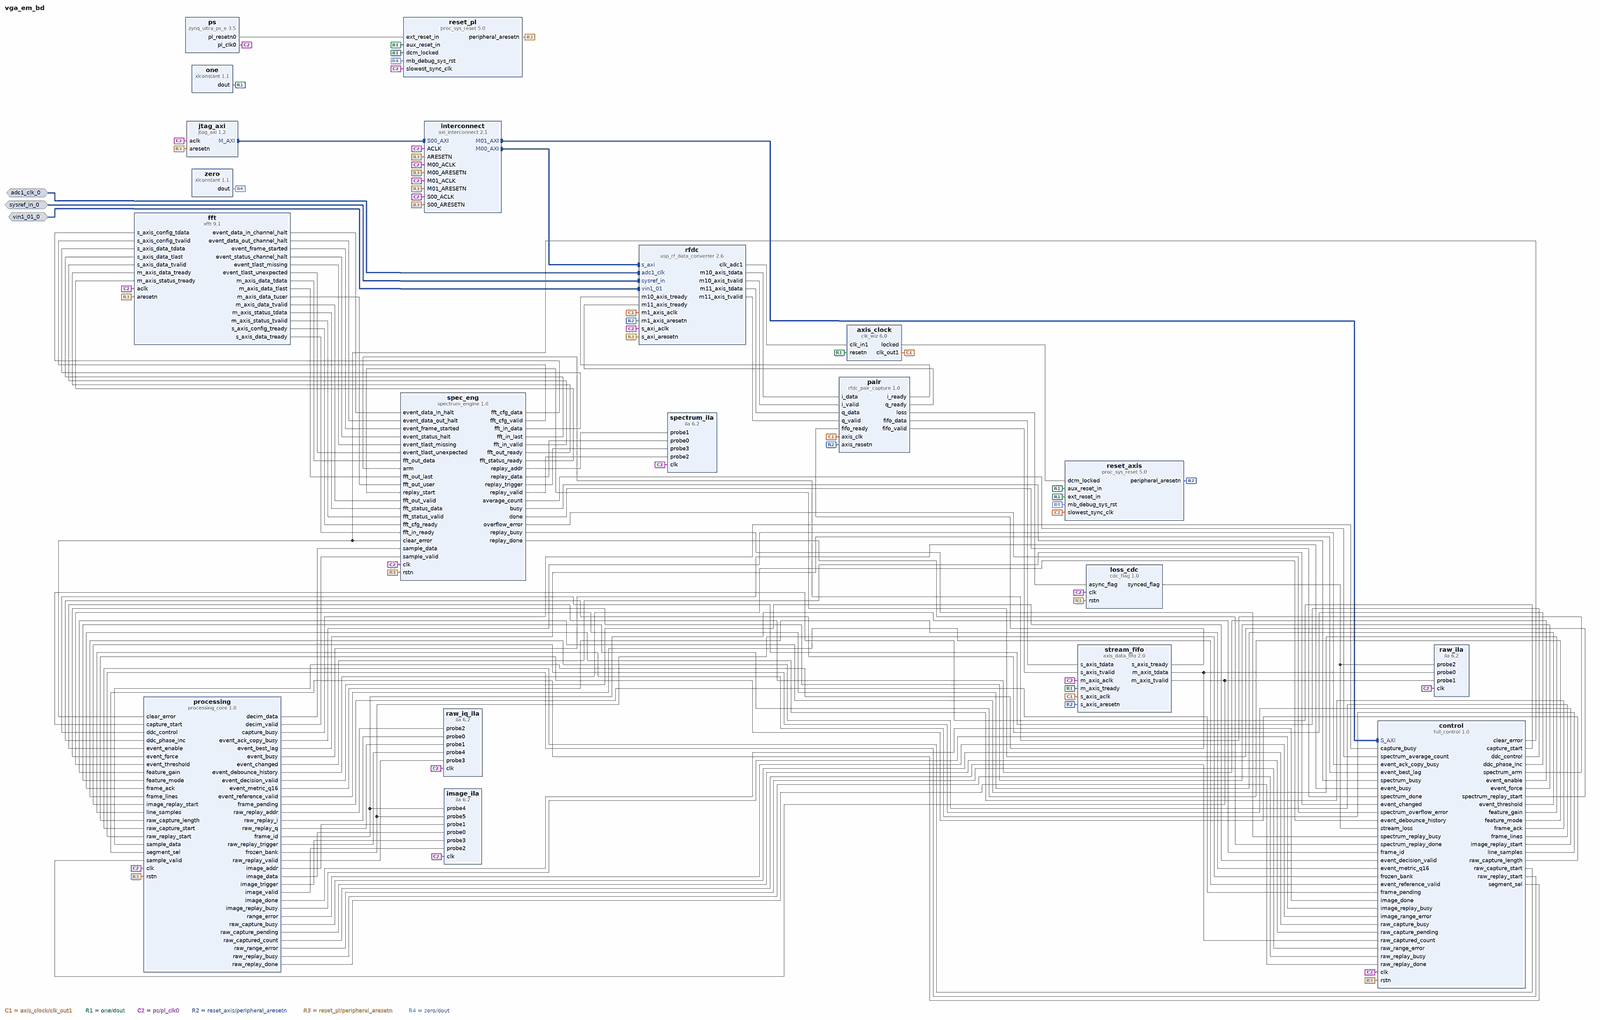
[diagram p0: block diagram of the top level, whole]
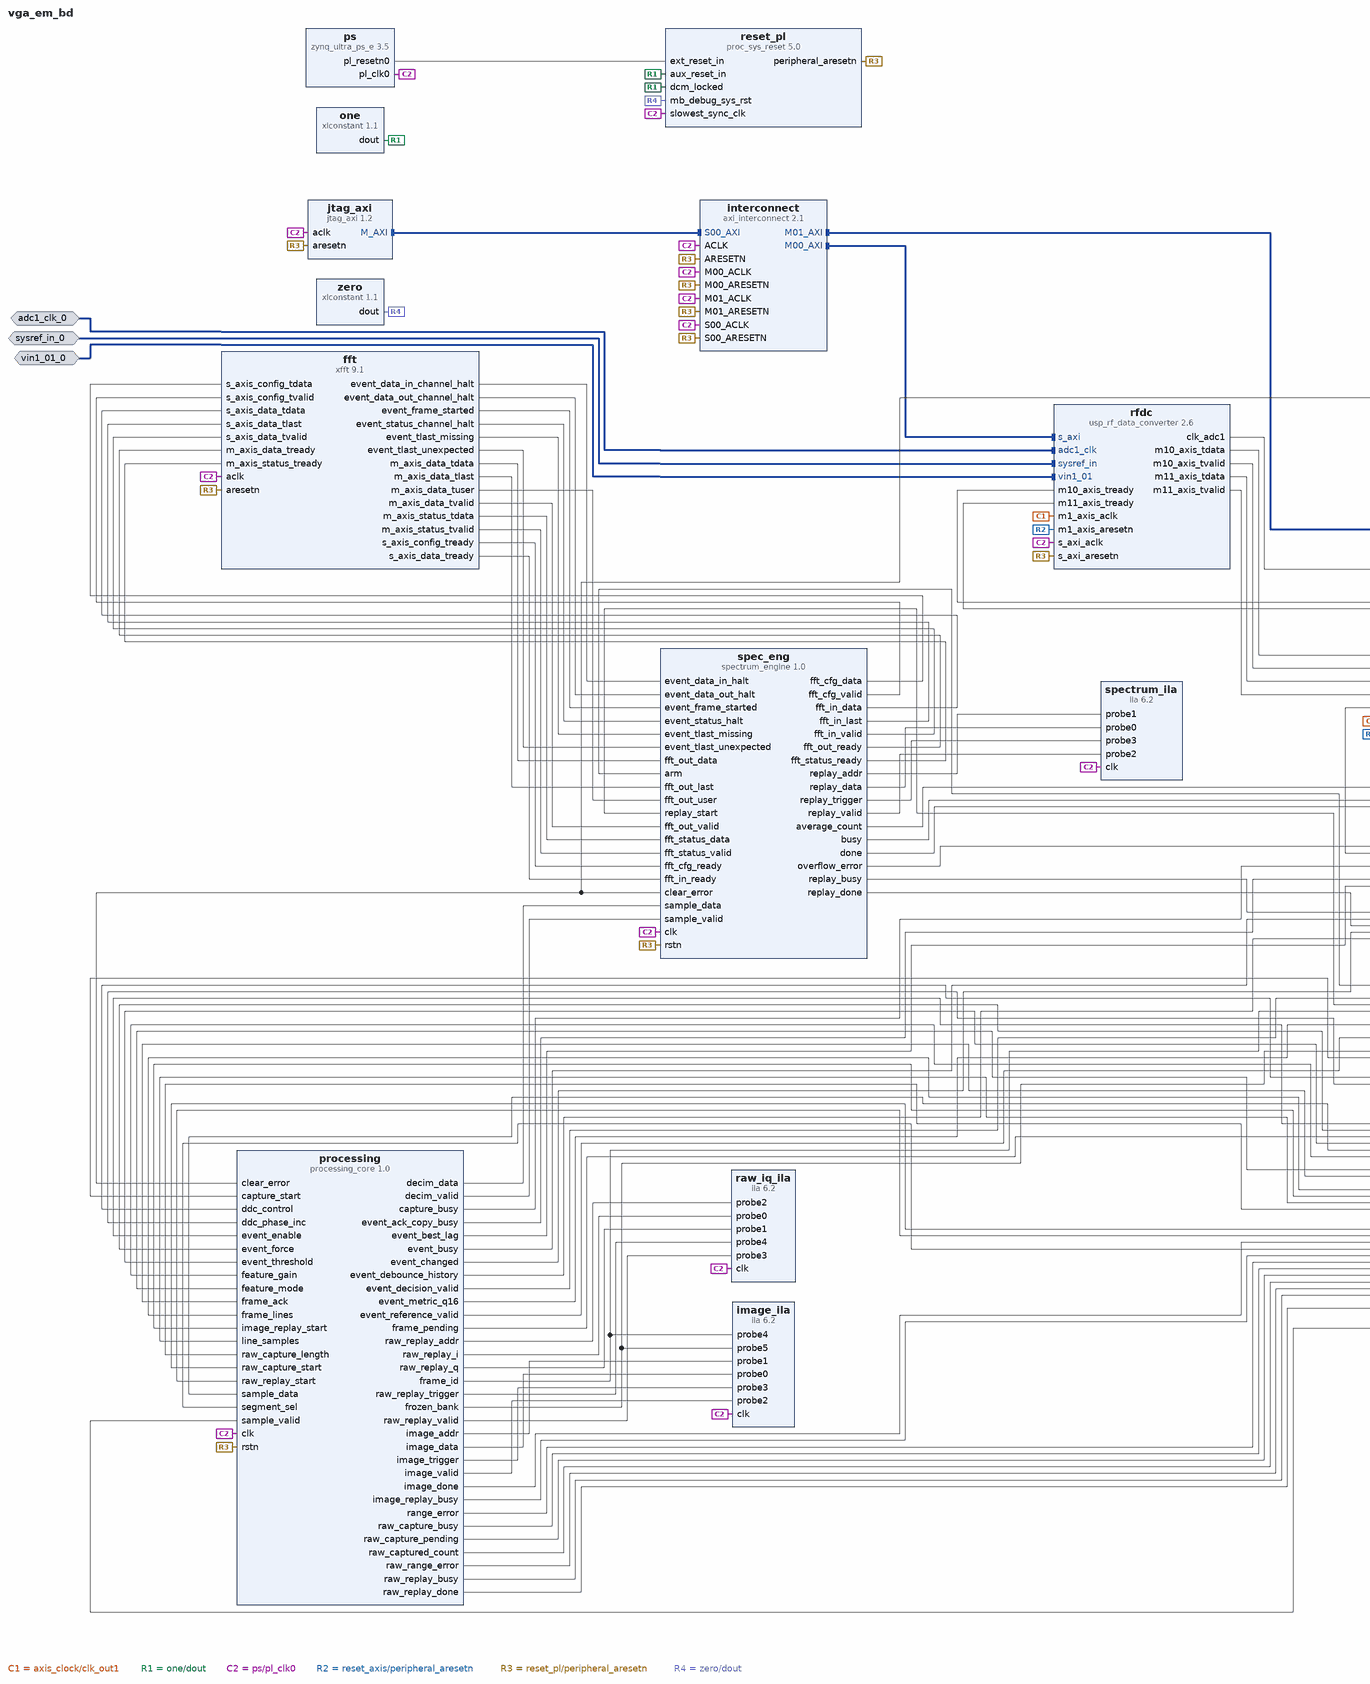
[diagram p1: block diagram of the top level, left part]
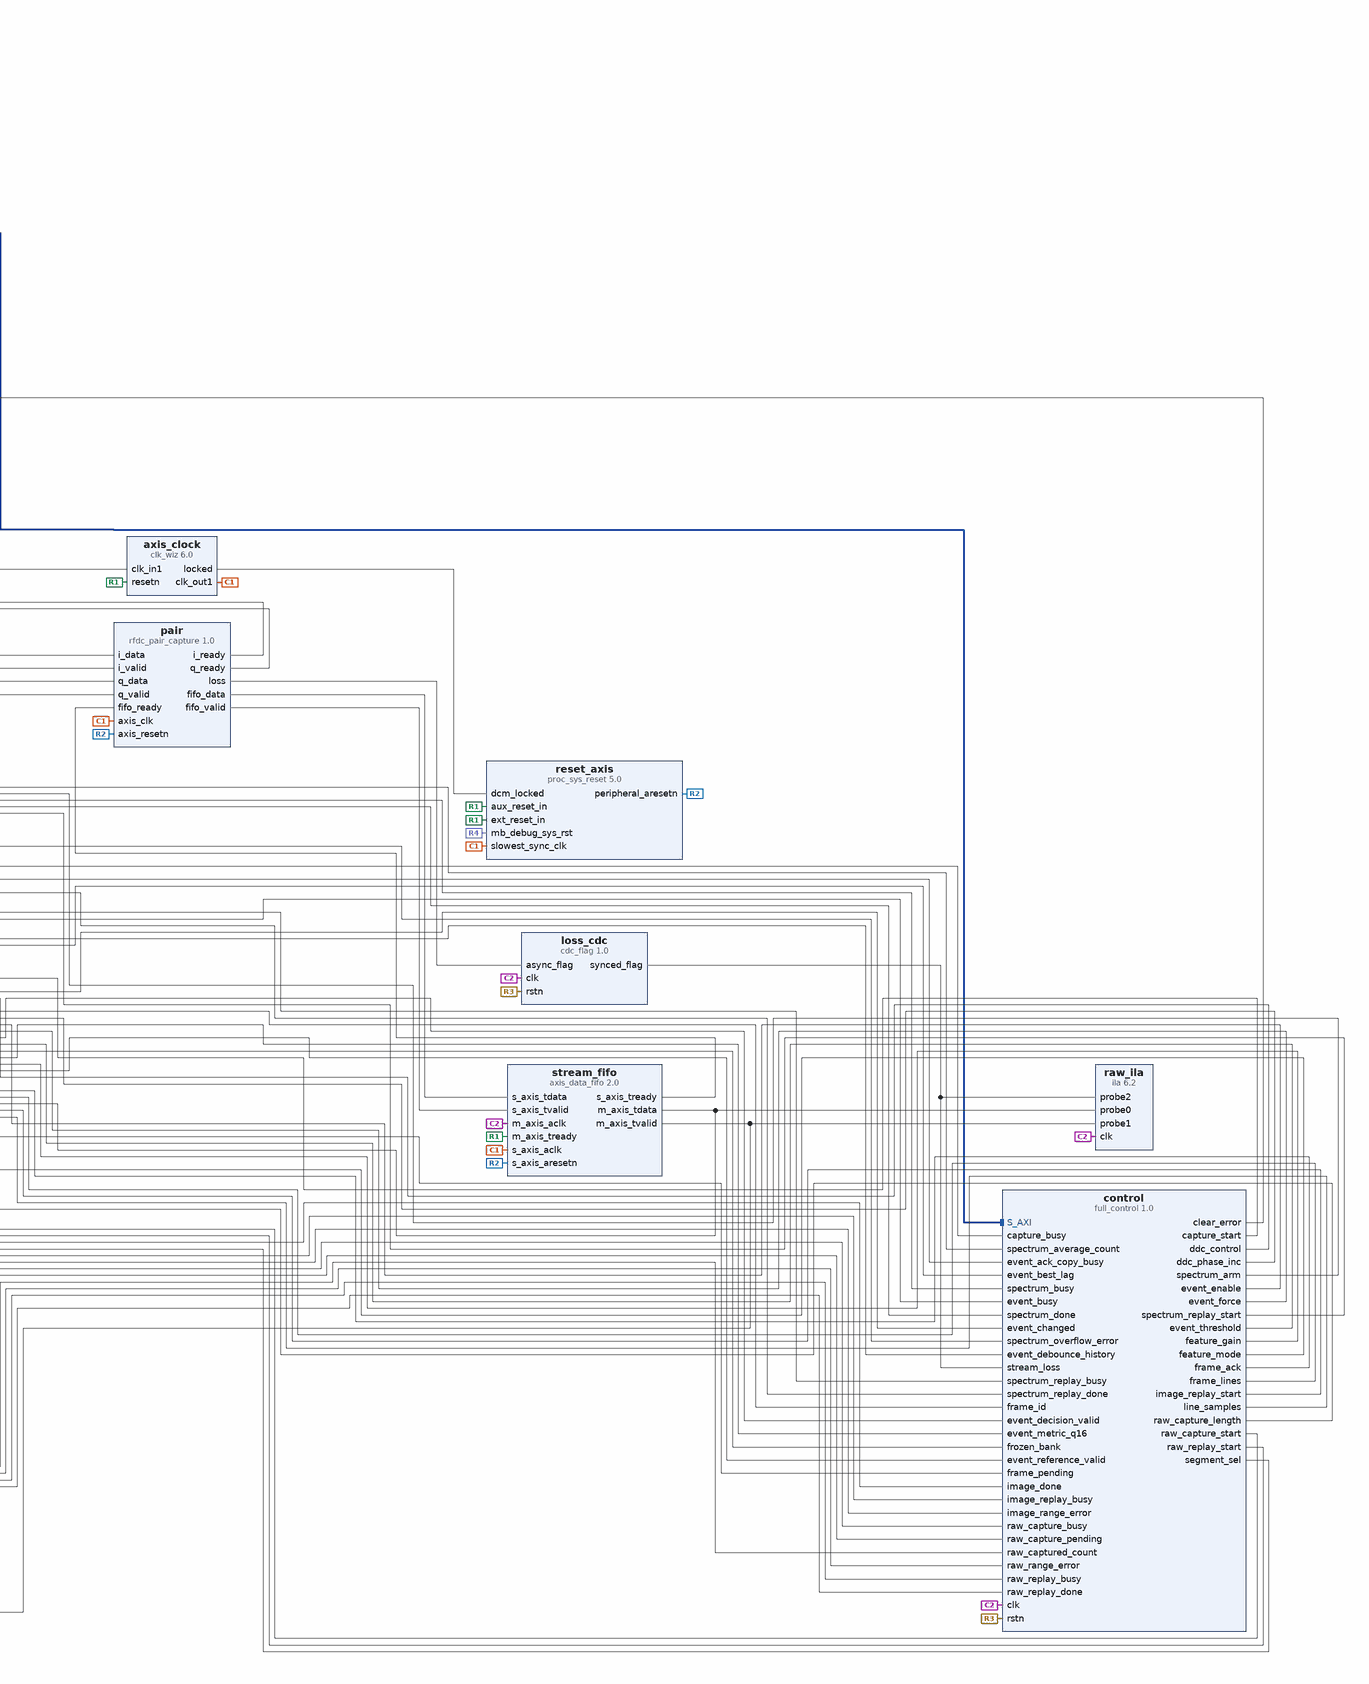
[diagram p2: block diagram of the top level, right part]
# Vivado block design vga_em_bd, xczu27dr-ffve1156-2-i, Vivado 2026.1
create_bd_design vga_em_bd

create_bd_intf_port -mode Slave -vlnv xilinx.com:interface:diff_clock_rtl:1.0 adc1_clk_0
create_bd_intf_port -mode Slave -vlnv xilinx.com:interface:diff_analog_io_rtl:1.0 vin1_01_0
create_bd_intf_port -mode Slave -vlnv xilinx.com:display_usp_rf_data_converter:diff_pins_rtl:1.0 sysref_in_0

create_bd_cell -type ip -vlnv xilinx.com:ip:usp_rf_data_converter:2.6 rfdc
set_property -dict [list \
  CONFIG.ADC1_PLL_Enable true \
  CONFIG.ADC1_Refclk_Freq 200.000 \
  CONFIG.ADC1_Sampling_Rate 1.04 \
  CONFIG.ADC_Data_Type10 1 \
  CONFIG.ADC_Data_Width10 2 \
  CONFIG.ADC_Decimation_Mode10 8 \
  CONFIG.ADC_Mixer_Mode10 0 \
  CONFIG.ADC_Mixer_Type10 2 \
  CONFIG.ADC_NCO_Freq10 -0.2 \
  CONFIG.ADC_Slice00_Enable false \
  CONFIG.ADC_Slice10_Enable true \
  CONFIG.Axiclk_Freq 200.000 \
] [get_bd_cells rfdc]
create_bd_cell -type ip -vlnv xilinx.com:ip:clk_wiz:6.0 axis_clock
set_property -dict [list \
  CONFIG.CLKOUT1_REQUESTED_OUT_FREQ 65.000 \
  CONFIG.PRIM_IN_FREQ 16.250 \
  CONFIG.PRIM_SOURCE No_buffer \
  CONFIG.RESET_TYPE ACTIVE_LOW \
] [get_bd_cells axis_clock]
create_bd_cell -type ip -vlnv xilinx.com:ip:xlconstant:1.1 zero
set_property -dict {CONFIG.CONST_VAL 0} [get_bd_cells zero]
create_bd_cell -type ip -vlnv xilinx.com:ip:xlconstant:1.1 one
set_property -dict {CONFIG.CONST_VAL 1} [get_bd_cells one]
create_bd_cell -type ip -vlnv xilinx.com:ip:proc_sys_reset:5.0 reset_pl
set_property -dict {CONFIG.C_AUX_RESET_HIGH 0} [get_bd_cells reset_pl]
create_bd_cell -type ip -vlnv xilinx.com:ip:proc_sys_reset:5.0 reset_axis
set_property -dict {CONFIG.C_AUX_RESET_HIGH 0} [get_bd_cells reset_axis]
create_bd_cell -type ip -vlnv xilinx.com:ip:zynq_ultra_ps_e:3.5 ps
set_property -dict [list \
  CONFIG.PSU__CRL_APB__PL0_REF_CTRL__FREQMHZ 200.000 \
  CONFIG.PSU__CRL_APB__PL0_REF_CTRL__SRCSEL IOPLL \
  CONFIG.PSU__DDR_HIGH_ADDRESS_GUI_ENABLE 0 \
  CONFIG.PSU__FPGA_PL0_ENABLE 1 \
  CONFIG.PSU__USE__M_AXI_GP2 0 \
] [get_bd_cells ps]
# 26 more settings of ps are not shown: defaults, MIO pin electricals, DDR timing, and values the tool derives
create_bd_cell -type ip -vlnv xilinx.com:ip:jtag_axi:1.2 jtag_axi
set_property -dict {CONFIG.PROTOCOL 2} [get_bd_cells jtag_axi]
create_bd_cell -type ip -vlnv xilinx.com:ip:axi_interconnect:2.1 interconnect
set_property -dict {CONFIG.NUM_MI 2} [get_bd_cells interconnect]
create_bd_cell -type ip -vlnv user.org:vga_em:rfdc_pair_capture:1.0 pair
create_bd_cell -type ip -vlnv user.org:vga_em:cdc_flag:1.0 loss_cdc
create_bd_cell -type ip -vlnv user.org:vga_em:processing_core:1.0 processing
create_bd_cell -type ip -vlnv user.org:vga_em:spectrum_engine:1.0 spec_eng
create_bd_cell -type ip -vlnv user.org:vga_em:full_control:1.0 control
create_bd_cell -type ip -vlnv xilinx.com:ip:axis_data_fifo:2.0 stream_fifo
set_property -dict [list \
  CONFIG.FIFO_DEPTH 1024 \
  CONFIG.HAS_TKEEP 0 \
  CONFIG.HAS_TLAST 0 \
  CONFIG.IS_ACLK_ASYNC 1 \
  CONFIG.TDATA_NUM_BYTES 8 \
] [get_bd_cells stream_fifo]
create_bd_cell -type ip -vlnv xilinx.com:ip:xfft:9.1 fft
set_property -dict [list \
  CONFIG.aresetn true \
  CONFIG.data_format fixed_point \
  CONFIG.implementation_options pipelined_streaming_io \
  CONFIG.input_width 16 \
  CONFIG.output_ordering natural_order \
  CONFIG.phase_factor_width 16 \
  CONFIG.rounding_modes convergent_rounding \
  CONFIG.scaling_options block_floating_point \
  CONFIG.target_clock_frequency 200 \
  CONFIG.target_data_throughput 65 \
  CONFIG.transform_length 65536 \
  CONFIG.xk_index true \
] [get_bd_cells fft]
create_bd_cell -type ip -vlnv xilinx.com:ip:ila:6.2 raw_ila
set_property -dict [list \
  CONFIG.C_DATA_DEPTH 4096 \
  CONFIG.C_MONITOR_TYPE Native \
  CONFIG.C_NUM_OF_PROBES 3 \
  CONFIG.C_PROBE0_WIDTH 64 \
  CONFIG.C_PROBE1_WIDTH 1 \
  CONFIG.C_PROBE2_WIDTH 1 \
] [get_bd_cells raw_ila]
create_bd_cell -type ip -vlnv xilinx.com:ip:ila:6.2 spectrum_ila
set_property -dict [list \
  CONFIG.C_DATA_DEPTH 65536 \
  CONFIG.C_EN_STRG_QUAL 1 \
  CONFIG.C_MONITOR_TYPE Native \
  CONFIG.C_NUM_OF_PROBES 4 \
  CONFIG.C_PROBE0_WIDTH 8 \
  CONFIG.C_PROBE1_WIDTH 16 \
  CONFIG.C_PROBE2_WIDTH 1 \
  CONFIG.C_PROBE3_WIDTH 1 \
] [get_bd_cells spectrum_ila]
create_bd_cell -type ip -vlnv xilinx.com:ip:ila:6.2 image_ila
set_property -dict [list \
  CONFIG.C_DATA_DEPTH 131072 \
  CONFIG.C_EN_STRG_QUAL 1 \
  CONFIG.C_MONITOR_TYPE Native \
  CONFIG.C_NUM_OF_PROBES 6 \
  CONFIG.C_PROBE0_WIDTH 8 \
  CONFIG.C_PROBE1_WIDTH 21 \
  CONFIG.C_PROBE2_WIDTH 1 \
  CONFIG.C_PROBE3_WIDTH 1 \
  CONFIG.C_PROBE4_WIDTH 32 \
  CONFIG.C_PROBE5_WIDTH 1 \
] [get_bd_cells image_ila]
create_bd_cell -type ip -vlnv xilinx.com:ip:ila:6.2 raw_iq_ila
set_property -dict [list \
  CONFIG.C_DATA_DEPTH 32768 \
  CONFIG.C_EN_STRG_QUAL 1 \
  CONFIG.C_MONITOR_TYPE Native \
  CONFIG.C_NUM_OF_PROBES 5 \
  CONFIG.C_PROBE0_WIDTH 16 \
  CONFIG.C_PROBE1_WIDTH 16 \
  CONFIG.C_PROBE2_WIDTH 15 \
  CONFIG.C_PROBE3_WIDTH 1 \
  CONFIG.C_PROBE4_WIDTH 1 \
] [get_bd_cells raw_iq_ila]

# ---- connections ----

connect_bd_intf_net -intf_net adc1_clk_0_1 [get_bd_intf_ports adc1_clk_0] [get_bd_intf_pins rfdc/adc1_clk]
connect_bd_intf_net [get_bd_intf_pins interconnect/M00_AXI] [get_bd_intf_pins rfdc/s_axi]
connect_bd_intf_net [get_bd_intf_pins interconnect/M01_AXI] [get_bd_intf_pins control/S_AXI]
connect_bd_intf_net [get_bd_intf_pins jtag_axi/M_AXI] [get_bd_intf_pins interconnect/S00_AXI]
connect_bd_intf_net -intf_net sysref_in_0_1 [get_bd_intf_ports sysref_in_0] [get_bd_intf_pins rfdc/sysref_in]
connect_bd_intf_net -intf_net vin1_01_0_1 [get_bd_intf_ports vin1_01_0] [get_bd_intf_pins rfdc/vin1_01]
connect_bd_net [get_bd_pins axis_clock/clk_out1] \
  [get_bd_pins rfdc/m1_axis_aclk] [get_bd_pins reset_axis/slowest_sync_clk] [get_bd_pins pair/axis_clk] \
  [get_bd_pins stream_fifo/s_axis_aclk]
connect_bd_net [get_bd_pins axis_clock/locked] [get_bd_pins reset_axis/dcm_locked]
connect_bd_net [get_bd_pins control/capture_start] [get_bd_pins processing/capture_start]
connect_bd_net [get_bd_pins control/clear_error] [get_bd_pins processing/clear_error] [get_bd_pins spec_eng/clear_error]
connect_bd_net [get_bd_pins control/ddc_control] [get_bd_pins processing/ddc_control]
connect_bd_net [get_bd_pins control/ddc_phase_inc] [get_bd_pins processing/ddc_phase_inc]
connect_bd_net [get_bd_pins control/event_enable] [get_bd_pins processing/event_enable]
connect_bd_net [get_bd_pins control/event_force] [get_bd_pins processing/event_force]
connect_bd_net [get_bd_pins control/event_threshold] [get_bd_pins processing/event_threshold]
connect_bd_net [get_bd_pins control/feature_gain] [get_bd_pins processing/feature_gain]
connect_bd_net [get_bd_pins control/feature_mode] [get_bd_pins processing/feature_mode]
connect_bd_net [get_bd_pins control/frame_ack] [get_bd_pins processing/frame_ack]
connect_bd_net [get_bd_pins control/frame_lines] [get_bd_pins processing/frame_lines]
connect_bd_net [get_bd_pins control/image_replay_start] [get_bd_pins processing/image_replay_start]
connect_bd_net [get_bd_pins control/line_samples] [get_bd_pins processing/line_samples]
connect_bd_net [get_bd_pins control/raw_capture_length] [get_bd_pins processing/raw_capture_length]
connect_bd_net [get_bd_pins control/raw_capture_start] [get_bd_pins processing/raw_capture_start]
connect_bd_net [get_bd_pins control/raw_replay_start] [get_bd_pins processing/raw_replay_start]
connect_bd_net [get_bd_pins control/segment_sel] [get_bd_pins processing/segment_sel]
connect_bd_net [get_bd_pins control/spectrum_arm] [get_bd_pins spec_eng/arm]
connect_bd_net [get_bd_pins control/spectrum_replay_start] [get_bd_pins spec_eng/replay_start]
connect_bd_net [get_bd_pins fft/event_data_in_channel_halt] [get_bd_pins spec_eng/event_data_in_halt]
connect_bd_net [get_bd_pins fft/event_data_out_channel_halt] [get_bd_pins spec_eng/event_data_out_halt]
connect_bd_net [get_bd_pins fft/event_frame_started] [get_bd_pins spec_eng/event_frame_started]
connect_bd_net [get_bd_pins fft/event_status_channel_halt] [get_bd_pins spec_eng/event_status_halt]
connect_bd_net [get_bd_pins fft/event_tlast_missing] [get_bd_pins spec_eng/event_tlast_missing]
connect_bd_net [get_bd_pins fft/event_tlast_unexpected] [get_bd_pins spec_eng/event_tlast_unexpected]
connect_bd_net [get_bd_pins fft/m_axis_data_tdata] [get_bd_pins spec_eng/fft_out_data]
connect_bd_net [get_bd_pins fft/m_axis_data_tlast] [get_bd_pins spec_eng/fft_out_last]
connect_bd_net [get_bd_pins fft/m_axis_data_tuser] [get_bd_pins spec_eng/fft_out_user]
connect_bd_net [get_bd_pins fft/m_axis_data_tvalid] [get_bd_pins spec_eng/fft_out_valid]
connect_bd_net [get_bd_pins fft/m_axis_status_tdata] [get_bd_pins spec_eng/fft_status_data]
connect_bd_net [get_bd_pins fft/m_axis_status_tvalid] [get_bd_pins spec_eng/fft_status_valid]
connect_bd_net [get_bd_pins fft/s_axis_config_tready] [get_bd_pins spec_eng/fft_cfg_ready]
connect_bd_net [get_bd_pins fft/s_axis_data_tready] [get_bd_pins spec_eng/fft_in_ready]
connect_bd_net [get_bd_pins loss_cdc/synced_flag] [get_bd_pins control/stream_loss] [get_bd_pins raw_ila/probe2]
connect_bd_net [get_bd_pins one/dout] \
  [get_bd_pins axis_clock/resetn] [get_bd_pins reset_pl/aux_reset_in] [get_bd_pins reset_axis/aux_reset_in] \
  [get_bd_pins reset_pl/dcm_locked] [get_bd_pins reset_axis/ext_reset_in] [get_bd_pins stream_fifo/m_axis_tready]
connect_bd_net [get_bd_pins pair/fifo_data] [get_bd_pins stream_fifo/s_axis_tdata]
connect_bd_net [get_bd_pins pair/fifo_valid] [get_bd_pins stream_fifo/s_axis_tvalid]
connect_bd_net [get_bd_pins pair/i_ready] [get_bd_pins rfdc/m10_axis_tready]
connect_bd_net [get_bd_pins pair/loss] [get_bd_pins loss_cdc/async_flag]
connect_bd_net [get_bd_pins pair/q_ready] [get_bd_pins rfdc/m11_axis_tready]
connect_bd_net [get_bd_pins processing/capture_busy] [get_bd_pins control/capture_busy]
connect_bd_net [get_bd_pins processing/decim_data] [get_bd_pins spec_eng/sample_data]
connect_bd_net [get_bd_pins processing/decim_valid] [get_bd_pins spec_eng/sample_valid]
connect_bd_net [get_bd_pins processing/event_ack_copy_busy] [get_bd_pins control/event_ack_copy_busy]
connect_bd_net [get_bd_pins processing/event_best_lag] [get_bd_pins control/event_best_lag]
connect_bd_net [get_bd_pins processing/event_busy] [get_bd_pins control/event_busy]
connect_bd_net [get_bd_pins processing/event_changed] [get_bd_pins control/event_changed]
connect_bd_net [get_bd_pins processing/event_debounce_history] [get_bd_pins control/event_debounce_history]
connect_bd_net [get_bd_pins processing/event_decision_valid] [get_bd_pins control/event_decision_valid]
connect_bd_net [get_bd_pins processing/event_metric_q16] [get_bd_pins control/event_metric_q16]
connect_bd_net [get_bd_pins processing/event_reference_valid] [get_bd_pins control/event_reference_valid]
connect_bd_net [get_bd_pins processing/frame_id] [get_bd_pins control/frame_id] [get_bd_pins image_ila/probe4]
connect_bd_net [get_bd_pins processing/frame_pending] [get_bd_pins control/frame_pending]
connect_bd_net [get_bd_pins processing/frozen_bank] [get_bd_pins control/frozen_bank] [get_bd_pins image_ila/probe5]
connect_bd_net [get_bd_pins processing/image_addr] [get_bd_pins image_ila/probe1]
connect_bd_net [get_bd_pins processing/image_data] [get_bd_pins image_ila/probe0]
connect_bd_net [get_bd_pins processing/image_done] [get_bd_pins control/image_done]
connect_bd_net [get_bd_pins processing/image_replay_busy] [get_bd_pins control/image_replay_busy]
connect_bd_net [get_bd_pins processing/image_trigger] [get_bd_pins image_ila/probe3]
connect_bd_net [get_bd_pins processing/image_valid] [get_bd_pins image_ila/probe2]
connect_bd_net [get_bd_pins processing/range_error] [get_bd_pins control/image_range_error]
connect_bd_net [get_bd_pins processing/raw_capture_busy] [get_bd_pins control/raw_capture_busy]
connect_bd_net [get_bd_pins processing/raw_capture_pending] [get_bd_pins control/raw_capture_pending]
connect_bd_net [get_bd_pins processing/raw_captured_count] [get_bd_pins control/raw_captured_count]
connect_bd_net [get_bd_pins processing/raw_range_error] [get_bd_pins control/raw_range_error]
connect_bd_net [get_bd_pins processing/raw_replay_addr] [get_bd_pins raw_iq_ila/probe2]
connect_bd_net [get_bd_pins processing/raw_replay_busy] [get_bd_pins control/raw_replay_busy]
connect_bd_net [get_bd_pins processing/raw_replay_done] [get_bd_pins control/raw_replay_done]
connect_bd_net [get_bd_pins processing/raw_replay_i] [get_bd_pins raw_iq_ila/probe0]
connect_bd_net [get_bd_pins processing/raw_replay_q] [get_bd_pins raw_iq_ila/probe1]
connect_bd_net [get_bd_pins processing/raw_replay_trigger] [get_bd_pins raw_iq_ila/probe4]
connect_bd_net [get_bd_pins processing/raw_replay_valid] [get_bd_pins raw_iq_ila/probe3]
connect_bd_net [get_bd_pins ps/pl_clk0] \
  [get_bd_pins reset_pl/slowest_sync_clk] [get_bd_pins jtag_axi/aclk] [get_bd_pins interconnect/ACLK] \
  [get_bd_pins interconnect/S00_ACLK] [get_bd_pins interconnect/M00_ACLK] [get_bd_pins interconnect/M01_ACLK] \
  [get_bd_pins rfdc/s_axi_aclk] [get_bd_pins control/clk] [get_bd_pins processing/clk] [get_bd_pins spec_eng/clk] \
  [get_bd_pins loss_cdc/clk] [get_bd_pins stream_fifo/m_axis_aclk] [get_bd_pins fft/aclk] [get_bd_pins raw_ila/clk] \
  [get_bd_pins spectrum_ila/clk] [get_bd_pins image_ila/clk] [get_bd_pins raw_iq_ila/clk]
connect_bd_net [get_bd_pins ps/pl_resetn0] [get_bd_pins reset_pl/ext_reset_in]
connect_bd_net [get_bd_pins reset_axis/peripheral_aresetn] \
  [get_bd_pins rfdc/m1_axis_aresetn] [get_bd_pins pair/axis_resetn] [get_bd_pins stream_fifo/s_axis_aresetn]
connect_bd_net [get_bd_pins reset_pl/peripheral_aresetn] \
  [get_bd_pins jtag_axi/aresetn] [get_bd_pins interconnect/ARESETN] [get_bd_pins interconnect/S00_ARESETN] \
  [get_bd_pins interconnect/M00_ARESETN] [get_bd_pins interconnect/M01_ARESETN] [get_bd_pins rfdc/s_axi_aresetn] \
  [get_bd_pins control/rstn] [get_bd_pins processing/rstn] [get_bd_pins spec_eng/rstn] [get_bd_pins loss_cdc/rstn] \
  [get_bd_pins fft/aresetn]
connect_bd_net [get_bd_pins rfdc/clk_adc1] [get_bd_pins axis_clock/clk_in1]
connect_bd_net [get_bd_pins rfdc/m10_axis_tdata] [get_bd_pins pair/i_data]
connect_bd_net [get_bd_pins rfdc/m10_axis_tvalid] [get_bd_pins pair/i_valid]
connect_bd_net [get_bd_pins rfdc/m11_axis_tdata] [get_bd_pins pair/q_data]
connect_bd_net [get_bd_pins rfdc/m11_axis_tvalid] [get_bd_pins pair/q_valid]
connect_bd_net [get_bd_pins spec_eng/average_count] [get_bd_pins control/spectrum_average_count]
connect_bd_net [get_bd_pins spec_eng/busy] [get_bd_pins control/spectrum_busy]
connect_bd_net [get_bd_pins spec_eng/done] [get_bd_pins control/spectrum_done]
connect_bd_net [get_bd_pins spec_eng/fft_cfg_data] [get_bd_pins fft/s_axis_config_tdata]
connect_bd_net [get_bd_pins spec_eng/fft_cfg_valid] [get_bd_pins fft/s_axis_config_tvalid]
connect_bd_net [get_bd_pins spec_eng/fft_in_data] [get_bd_pins fft/s_axis_data_tdata]
connect_bd_net [get_bd_pins spec_eng/fft_in_last] [get_bd_pins fft/s_axis_data_tlast]
connect_bd_net [get_bd_pins spec_eng/fft_in_valid] [get_bd_pins fft/s_axis_data_tvalid]
connect_bd_net [get_bd_pins spec_eng/fft_out_ready] [get_bd_pins fft/m_axis_data_tready]
connect_bd_net [get_bd_pins spec_eng/fft_status_ready] [get_bd_pins fft/m_axis_status_tready]
connect_bd_net [get_bd_pins spec_eng/overflow_error] [get_bd_pins control/spectrum_overflow_error]
connect_bd_net [get_bd_pins spec_eng/replay_addr] [get_bd_pins spectrum_ila/probe1]
connect_bd_net [get_bd_pins spec_eng/replay_busy] [get_bd_pins control/spectrum_replay_busy]
connect_bd_net [get_bd_pins spec_eng/replay_data] [get_bd_pins spectrum_ila/probe0]
connect_bd_net [get_bd_pins spec_eng/replay_done] [get_bd_pins control/spectrum_replay_done]
connect_bd_net [get_bd_pins spec_eng/replay_trigger] [get_bd_pins spectrum_ila/probe3]
connect_bd_net [get_bd_pins spec_eng/replay_valid] [get_bd_pins spectrum_ila/probe2]
connect_bd_net [get_bd_pins stream_fifo/m_axis_tdata] [get_bd_pins processing/sample_data] [get_bd_pins raw_ila/probe0]
connect_bd_net [get_bd_pins stream_fifo/m_axis_tvalid] [get_bd_pins processing/sample_valid] [get_bd_pins raw_ila/probe1]
connect_bd_net [get_bd_pins stream_fifo/s_axis_tready] [get_bd_pins pair/fifo_ready]
connect_bd_net [get_bd_pins zero/dout] [get_bd_pins reset_pl/mb_debug_sys_rst] [get_bd_pins reset_axis/mb_debug_sys_rst]

# ---- address map ----
assign_bd_address -offset 0xA0000000 -range 256K -target_address_space [get_bd_addr_spaces jtag_axi/Data] [get_bd_addr_segs rfdc/s_axi/Reg]
assign_bd_address -offset 0xA0040000 -range 4K -target_address_space [get_bd_addr_spaces jtag_axi/Data] [get_bd_addr_segs control/S_AXI/reg0]

validate_bd_design
save_bd_design
